# EasyEDA Pro project wzh2814685-voltpen_v0-5-3f4d7379.epro, board 主控板PCB_板厚1.0
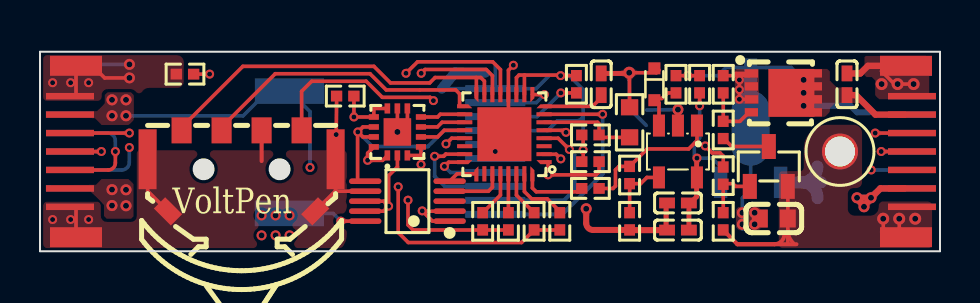
[diagram p1: board, top side]
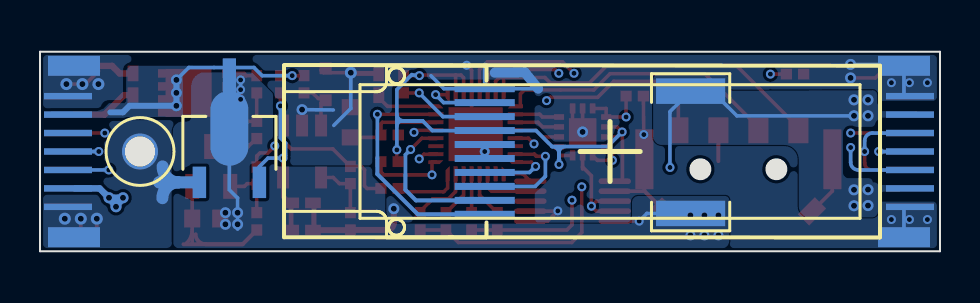
[diagram p2: board, bottom side, seen from below]

Outline 45 x 10 mm; copper layers: Top Layer, Inner1, Inner2, Bottom Layer. Coordinates in mm from the lower left corner of the outline.
Outline path: 0,10 45,10 45,0 0,0 0,10
Stack: Top Layer 0.035mm / Dielectric1 0.48mm PP er 4.5 / Inner1 0.035mm / Dielectric2 0.48mm FR4 er 4.5 / Inner2 0.035mm / Dielectric3 0.48mm PP er 4.5 / Bottom Layer 0.035mm

## Design rules (mm)
spacing safeClearance (default): track to track 0.152, other pairs 0.152 to 0.3
spacing Plane_innerPlane: track to track 0.152, other pairs 0.152 to 0.3
spacing Copper_copperRegion: track to track 0.152, other pairs 0.152 to 0.3
spacing Copper_gge50735: track to track 0.152, other pairs 0.152 to 0.3
spacing Copper_gge48593: track to track 0.152, other pairs 0.152 to 0.3
spacing Copper_gge170237: track to track 0.152, other pairs 0.152 to 0.3
spacing Copper_gge170600: track to track 0.152, other pairs 0.152 to 0.3
spacing Copper_gge170609: track to track 0.152, other pairs 0.152 to 0.3
spacing Copper_gge170501: track to track 0.152, other pairs 0.152 to 0.3
spacing Copper_gge170618: track to track 0.152, other pairs 0.152 to 0.3
spacing Copper_gge58469: track to track 0.152, other pairs 0.152 to 0.3
spacing Copper_gge67118: track to track 0.152, other pairs 0.152 to 0.3
track width trackWidth (default): min 0.127, default 0.254, max 2.54
differential pair differentialPair (default): width min 0.127, default 0.254, max 2.54; gap min 0.152, default 0.152
pour e532 uses Copper_copperRegion, gge50735
pour e539 uses Copper_copperRegion, gge170237
pour e541 uses Copper_copperRegion, gge170600
pour e543 uses Copper_copperRegion, gge170609
pour e545 uses Copper_copperRegion, gge170501
pour e547 uses Copper_copperRegion, gge170618
pour e550 uses Copper_copperRegion, gge58469
pour e552 uses Copper_copperRegion, gge67118
pour e537 uses Copper_copperRegion

## Placement (name value [footprint] x y rotation side)
C1  10uF  [C0603]  36.69 1.64 0 top
C2  10uF  [C0402]  31.9 1.06 180 top
C3  100nF  [C0402]  28.06 8.37 270 top
C4  100nF  [C0402]  31.9 2.42 0 top
C5  100nF  [C0402]  40.35 8.37 270 top
D1  1N4148WT  [SOD-523_L1.2-W0.8-LS1.6-FD]  30.72 8.37 270 top
NOREF  -  [Pad_e86]  40 5 0 top
Q1  WSD30L30DN  [WDFN-8_L3.3-W3.3-P0.65-BL]  37.17 7.94 270 top
Q2  S8050 J3Y  [SOT-23-3_L2.9-W1.3-P1.90-LS2.4-BR]  36.44 4.25 270 top
R1  10kΩ  [R0402]  27.52 5.83 180 top
R2  15R  [R0402]  26.82 8.37 90 top
R3  5.1kΩ  [R0402]  31.8 8.37 270 top
R4  1kΩ  [R0402]  29.48 1.5 90 top
R5  200kΩ  [R0402]  29.48 3.82 90 top
R6  1kΩ  [R0402]  27.52 3.15 180 top
R7  1kΩ  [R0402]  34.16 3.79 270 top
R8  1kΩ  [R0402]  34.16 6.08 90 top
R9  10kΩ  [R0402]  34.16 8.37 270 top
R10  1MΩ  [R0402]  32.98 8.37 90 top
R11  5.1kΩ  [R0402]  25.99 1.5 90 top
R12  1kΩ  [R0402]  24.7 1.5 270 top
R13  5.1kΩ  [R0402]  22.13 1.5 90 top
R14  1kΩ  [R0402]  23.42 1.5 270 top
R15  5.1kΩ  [R0402]  27.52 4.49 180 top
R16  10kΩ  [R0402]  34.16 1.5 90 top
R17  NC  [R0402]  15.26 7.78 180 top
R18  NC  [R0402]  7.25 8.88 180 top
R19  5mΩ  [R2512]  12.47 4.96 270 bottom
RT1  KNTC0603/10KF3950  [R0603]  29.48 6.46 90 top
SW1  TM-2023  [SW-SMD_TM-2023-1]  10.08 4.03 180 top
TFT-1  LCD-0.99-GC9D01  [0.99寸-GC9D01N]  16.5 5 180 bottom
U1  AI8H8K64U-45I-QFN32  [QFN-32_L4.0-W4.0-P0.40-TL-EP2.7-1]  23.22 5.87 180 top
U2  TP1541A-TR  [SOT-23-5_L3.0-W1.7-P0.95-LS2.8-BR]  31.9 5 90 top
U3  FUSB302BMPX  [MLP-14_L2.5-W2.5-P0.50-BL-EP]  17.87 5.98 0 top
U4  INA226AIDGSR  [MSOP-10_L3.0-W3.0-P0.50-LS5.0-BL]  18.37 2.51 90 top
U5  SE8533-HF  [SOT-89-3_L4.5-W2.5-P1.50-LS4.2-BR]  35.53 4.81 270 bottom
USB1  TYPE-C 14P母座 夹板  [TYPE-C 14P母座]  -3.9 5 90 top
USB2  TYPE-C 14P母座 夹板  [TYPE-C 14P母座]  49 5 270 top

## Footprints (pads in the part's own frame, mm; a bottom-side part is the same pattern mirrored in y, then rotated)
0.99寸-GC9D01N
  custom 3x0.35 smd: 1(-6.264,-3.15) 2(-6.264,-2.45) 3(-6.264,-1.75) 4(-6.264,-1.05) 5(-6.264,-0.35) 6(-6.264,0.35) 7(-6.264,1.05) 8(-6.264,1.75) 9(-6.264,2.45) 10(-6.264,3.15)
C0402
  rect 0.79x0.54 smd: 1(-0.545,0) 2(0.545,0)
C0603
  rect 0.8x0.9 smd: 1(-0.7,0) 2(0.7,0)
MLP-14_L2.5-W2.5-P0.50-BL-EP
  rect 0.28x0.505 smd: 1(-0.5,-1.177) 2(0,-1.177) 3(0.5,-1.177) 8(0.5,1.177) 9(0,1.177) 10(-0.5,1.177)
  rect 0.505x0.28 smd: 4(1.177,-0.75) 5(1.177,-0.25) 6(1.177,0.25) 7(1.177,0.75) 11(-1.177,0.75) 12(-1.177,0.25) 13(-1.177,-0.25) 14(-1.177,-0.75)
  rect 1.375x1.375 smd: 15(0,0)
MSOP-10_L3.0-W3.0-P0.50-LS5.0-BL
  oval 0.28x1.62 smd: 1(-1,-2.111) 2(-0.5,-2.111) 3(0,-2.111) 4(0.5,-2.111) 5(1,-2.111) 6(1,2.11) 7(0.5,2.11) 8(0,2.11) 9(-0.5,2.11) 10(-1,2.11)
Pad_e86
  round 1.8 hole 1.5: 4(0,0)
QFN-32_L4.0-W4.0-P0.40-TL-EP2.7-1
  custom 0.76x0.2 smd: 1(-1.985,1.4) 8(-1.985,-1.4) 17(1.985,-1.4) 24(1.985,1.4)
  rect 0.76x0.2 smd: 2(-1.985,1) 3(-1.985,0.6) 4(-1.985,0.2) 5(-1.985,-0.2) 6(-1.985,-0.6) 7(-1.985,-1) 18(1.985,-1) 19(1.985,-0.6) 20(1.985,-0.2) 21(1.985,0.2) 22(1.985,0.6) 23(1.985,1)
  custom 0.2x0.76 smd: 9(-1.401,-1.985) 16(1.399,-1.985) 25(1.399,1.985) 32(-1.401,1.985)
  rect 0.2x0.76 smd: 10(-1,-1.985) 11(-0.6,-1.985) 12(-0.2,-1.985) 13(0.2,-1.985) 14(0.6,-1.985) 15(1,-1.985) 26(1,1.985) 27(0.6,1.985) 28(0.2,1.985) 29(-0.2,1.985) 30(-0.6,1.985) 31(-1,1.985)
  rect 2.7x2.7 smd: 33(0,0)
R0402
  rect 0.566x0.54 smd: 1(-0.433,0) 2(0.433,0)
R0603
  rect 0.806x0.864 smd: 1(-0.753,0) 2(0.753,0)
R2512
  rect 1.282x3.456 smd: 1(-3.067,0) 2(3.066,0)
SOD-523_L1.2-W0.8-LS1.6-FD
  rect 0.6x0.6 smd: 1(-0.8,0) 2(0.8,0)
SOT-23-3_L2.9-W1.3-P1.90-LS2.4-BR
  rect 1.25x0.7 smd: 1(1,-0.95) 2(1,0.95) 3(-1,0)
SOT-23-5_L3.0-W1.7-P0.95-LS2.8-BR
  rect 1.1x0.6 smd: 1(1.3,-0.95) 2(1.3,0) 3(1.3,0.95) 4(-1.3,0.95) 5(-1.3,-0.95)
SOT-89-3_L4.5-W2.5-P1.50-LS4.2-BR
  rect 1.575x0.672 smd: 1(1.357,-1.5) 3(1.357,1.5)
  custom 5.377x1.9 smd: 2(-1.356,-0.001)
SW-SMD_TM-2023-1
  rect 1x1.3 smd: 1(-3,-2.03) 2(3,-2.03) C(-1,-2.03) T(1,-2.03)
  rect 0.9x3 smd: 3(-4.7,-0.58) 4(4.7,-0.58)
  rect 1.2x0.8 smd rot 135: 5(3.68,2.03)
  rect 1.2x0.8 smd rot 45: 6(-3.68,2.03)
TYPE-C 14P母座
  rect 0.32x2.4 smd: A1(2.775,-5.4) A4(1.85,-5.4) A5(0.925,-5.4) A6(0,-5.4) A7(-0.925,-5.4) A9(-1.85,-5.4) A12(-2.775,-5.4)
  rect 0.32x2.4 smd far side: B1(-2.775,-5.4) B4(-1.85,-5.4) B5(-0.925,-5.4) B6(0,-5.4) B7(0.925,-5.4) B9(1.85,-5.4) B12(2.775,-5.4)
  rect 1x2.6 smd: SH(-4.295,-5.7) SH(4.295,-5.7)
  rect 1x2.6 smd far side: SH(-4.295,-5.7) SH(4.295,-5.7)
WDFN-8_L3.3-W3.3-P0.65-BL
  rect 0.42x0.66 smd: 1(-0.975,-1.6) 2(-0.325,-1.6) 3(0.325,-1.6) 4(0.975,-1.6) 5(-0.975,1.6) 5(-0.325,1.6) 5(0.325,1.6) 5(0.975,1.6)
  rect 2.4x2.3 smd: 5(0,0.4)

## Nets
As in the schematic, except:
GND: C1.2 C2.2 C3.1 C4.1 C5.1 D1.1 NOREF.4 Q2.2 R4.1 R16.1 R17.2 R18.2 RT1.2 SW1.3 SW1.4 SW1.5 SW1.6 SW1.C TFT-1.5 TFT-1.6 TFT-1.10 U1.12 U1.33 U2.2 U3.8 U3.9 U3.15 U4.1 U4.2 U4.7 U5.1 USB1.A1 USB1.A12 USB1.B1 USB1.B12 USB1.SH USB2.A1 USB2.A12 USB2.B1 USB2.B12 USB2.SH

Pads without a net: U1 3 22 26; U4 3; USB2 A5 B5

## Via types
v1: diameter 0.45, hole 0.25, Top Layer to Bottom Layer, 48 vias
v2: diameter 0.55, hole 0.3, Top Layer to Bottom Layer, 12 vias
v3: diameter 0.6, hole 0.3, Top Layer to Bottom Layer, 7 vias
v4: diameter 0.5, hole 0.25, Top Layer to Bottom Layer, 1 via
v5: diameter 0.555, hole 0.3, Top Layer to Bottom Layer, 11 vias
v6: diameter 0.5, hole 0.3, Top Layer to Bottom Layer, 6 vias

## Routing (per net, layer and track width the routed paths; a pad name or vN(x,y) marks a point on that pad's centre or on a via; arc(x,y) is an arc through that point)
3.3V: length 50.3
  Top Layer w0.18: 24.22,8.83 23.95,8.83 23.82,8.7 23.82,7.85 ; 24.22,8.83 24.22,7.85 ; 24.22,8.83 26.03,8.83 ; 19.05,4.8 19.05,4.8 ; 19.05,4.8 18.37,4.8 ; 19.05,4.8 19.05,4.35 ; 27.16,5.71 27.16,4.43 ; 16.69,5.73 16.14,5.73 15.9,5.98 16.15,6.23 16.69,6.23 ; 19.05,4.8 19.05,5.23 ; 15.88,6.05 15.88,3.51 16.26,3.51 ; 32.98,7.94 32.98,7.28 ; 26.03,8.8 26.82,8.8
  Top Layer w0.24: 32.45,1.06 32.45,2.42 32.52,2.42 32.83,2.73 32.83,4.67
  Inner1 w0.25: v1(32.85,4.67) 27.57,4.67 v1(27.16,5.08)
  Bottom Layer w0.18: 18.74,5.25 arc(18.96,5.16) 19.05,4.94 v1(19.05,4.35) ; 19.4,5.25 arc(19.15,5.15) 19.05,4.9 v1(19.05,4.35) ; 19.4,5.25 16.62,5.25 15.89,5.98 ; 19.4,5.25 20.2,6.05 ; 27.16,6.27 arc(27.08,6.46) 26.88,6.54 25.87,6.54 26.83,6.54 arc(27.06,6.64) 27.16,6.87 ; v1(19.05,4.35) 19.05,5.25 ; v1(32.85,4.67) 32.72,4.8 32.72,5.42 32.98,5.68 v1(32.98,7.29) ; 27.16,6.54 25.87,6.54 25.38,6.05 20.2,6.05 ; 34.03,3.45 34.03,4.24 33.6,4.67 32.85,4.67 ; v1(27.16,5.08) 27.16,8.1 26.41,8.85 26.38,8.83 26.03,8.83
  vias: v1(15.89,5.98) v1(26.03,8.8)
GND: length 90.2
  Top Layer w0.18: 37.67,0.41 arc(37.46,0.72) 37.39,1.08 ; 23.22,5.86 23.42,6.06 23.42,9.08 23.67,9.32 ; 37.39,0.41 37.39,3.25 ; 14.83,7.78 14.81,5.85 ; 20.48,2.01 19.13,2.01 ; 19.13,2.01 19.11,2.02 ; 19.13,2.01 19.63,1.51 20.48,1.51 ; 4.48,8.69 3.23,8.69 2.56,9.36 1.8,9.36 1.8,7.82 1.4,7.82 ; 17.87,6.29 18.37,6.29 18.37,7.16 ; 17.87,6.29 17.87,5.98 ; 17.87,6.29 17.44,6.29 ; 17.87,6.29 17.87,7.16 ; 31.31,1.19 31.3,1.18 ; 43.68,8.38 42.72,8.38 42.07,9.03 ; 42.16,1.63 42.16,1.04 42.08,0.96 ; 30.96,9.08 30.82,8.95 29.46,8.95 ; 1.4,2.27 1.8,2.27 1.8,0.72 ; 16.26,3.01 14.78,3.01 ; 42.88,0.96 42.96,1.04 42.96,1.63 ; 29.48,7.22 29.47,8.91 ; 31.12,1.01 31.12,0.97 ; 5.38,4.61 5.38,3.02 6.4,2
  Top Layer w0.2: 37.22,0.85 arc(37.07,0.5) 36.72,0.35 34.87,0.35 ; 11.08,6.06 11.08,4.52 ; 14.78,4.61 14.78,3.02 13.76,2 ; 34.15,1.07 34.87,0.35 37.82,0.35
  Top Layer w0.25: 29.46,8.95 29.43,8.91 28.06,8.91 ; 31.9,6.3 31.9,7.1 ; 31.31,2.47 31.31,1.19 31.3,1.18 31.18,1.06 31.12,1.01 31.12,0.98
  Top Layer w0.3: 27.65,1.07 arc(27.41,1.17) 27.31,1.41 v2(27.31,2.13) ; 29.49,1.06 arc(29.48,1.06) R4.1 ; 29.48,1.07 27.66,1.07 ; 31.35,1.06 29.49,1.06
  Top Layer w0.32: 42.94,9.29 41.4,9.29 41.02,8.91 40.35,8.91
  Inner1 w0.18: 1.8,9.37 1.8,0.73
  Bottom Layer w0.18: 4.49,9.36 1.8,9.36 1.8,7.82 1.4,7.82 ; 1.4,2.27 1.8,2.27 1.8,0.72 ; v3(29.46,8.95) 29.46,7.16 30.31,6.31 ; v2(31.9,7.1) 30.33,7.08 ; 22.77,5.35 22.77,4.65 ; 22.76,8.15 19.98,8.15 ; 22.77,9.37 22.77,8.15 24.8,8.15 25.45,8.8
  Bottom Layer w0.5: 22.26,8.95 20.76,8.97 20.09,8.15
  Bottom Layer w0.6: 38.09,3.45 arc(38.65,3.22) 38.88,2.66 ; 38.87,4.25 arc(38.64,3.69) 38.07,3.45 ; 39.04,3.46 arc(39.04,3.46) 39.03,3.45 ; 37.03,3.45 39.03,3.45
  vias: v1(0.63,8.45) v1(0.63,1.59) v1(1.53,8.45) v1(1.53,1.59) v1(2.43,8.45) v1(2.43,1.59) v1(14.81,5.85) v1(19.11,2.02) v1(23.67,9.32) v3(42.08,8.38) v3(42.16,1.63) v3(42.88,8.38) v3(42.96,1.63) v3(43.68,8.38) v3(43.76,1.63) v2(4.47,9.37) v2(4.47,8.69) v2(17.87,5.98) v4(22.76,5)
VBUS: length 13.6
  Top Layer w0.18: 34.97,8.59 34.97,8.1 ; 34.69,8.8 35.46,8.8 35.57,8.91 34.8,8.91 34.69,8.8 ; 34.69,8.8 34.16,8.8 ; 15.04,1.51 16.26,1.51 ; 35.57,7.61 34.97,7.61 ; v1(34.97,8.1) v1(34.97,7.61)
  Bottom Layer w0.18: 34.97,8.59 34.97,8.1 ; 15.04,1.51 14.66,1.89 12.47,1.89 ; 35.53,6.17 35.53,3.08 35.12,2.67 v2(35.12,1.93) 35.12,1.11
  vias: v1(15.04,1.51) v1(34.97,8.59) v2(35.12,1.35) v2(35.73,1.93) v2(35.73,1.35) v6(11.08,1.8) v6(11.08,0.8) v6(11.78,1.8) v6(11.78,0.8) v6(12.48,1.8) v6(12.48,0.8)
VBUS_I: length 23
  Top Layer w0.18: 16.26,2.01 17.18,2.01 17.43,2.26 ; 17.87,4.23 17.87,4.12 ; 17.87,4.23 17.43,3.79 17.43,2.26 ; 17.87,4.23 17.87,4.8 ; 16.26,2.51 17.18,2.51 17.43,2.26
  Inner2 w0.18: v1(17.43,2.26) 15.44,2.26 v1(13.5,4.2)
  Bottom Layer w0.18: 13.5,4.2 13.5,7 12.47,8.02 11.39,8.02 10.15,6.79 4.3,6.79
  vias: v5(3.6,7.59) v5(3.6,6.79) v5(3.6,3.09) v5(3.6,2.29) v5(4.3,7.59) v5(4.3,6.79) v5(4.3,3.08) v5(4.3,2.28)
ADC_IRON: length 3.3
  Top Layer w0.18: U1.32 24.62,3.17 24.81,2.98 26.92,2.98 27.09,3.15
ADCN: length 4.8
  Top Layer w0.18: 25.21,6.46 27.88,6.46 27.96,6.39 27.96,5.83 ; 28.02,5.71 29.48,5.71
BK: length 3.2
  Top Layer w0.18: U1.9 v1(25.22,7.85)
  Bottom Layer w0.18: v1(25.22,7.85) 24.82,7.45 TFT-1.9
CC1: length 17.7
  Top Layer w0.18: 15.7,7.78 15.7,6.73 ; 15.7,6.73 16.69,6.73 16.69,7.16 17.37,7.16 ; 1.5,5.92 4.47,5.92
  Inner1 w0.18: v1(4.47,5.92) 5.18,5.92 5.98,6.73 v1(15.7,6.73)
CC2: length 31.6
  Top Layer w0.18: 17.37,4.8 17.13,4.56 16.38,4.56 16.38,4.92 16.7,5.23 ; 7.68,8.88 8.48,8.88
  Inner1 w0.18: 16.15,5.2 arc(16.31,5.13) 16.38,4.97 v1(16.38,4.56) 16.38,5.2 ; 16.38,5.03 arc(16.41,5.19) 16.5,5.32 ; 16.5,5.32 arc(16.47,5.24) 16.38,5.2 ; 16.5,5.32 16.5,6.92 arc(16.36,7.26) 16.02,7.4 8.99,7.4 arc(8.63,7.55) 8.48,7.91 v1(8.48,8.88) ; 16.38,5.2 v1(4.47,5.2)
  Bottom Layer w0.18: 4.09,4.08 arc(4.36,4.19) 4.47,4.46 v1(4.47,5.2) ; 1.5,4.07 4.09,4.07
D+: length 37.4
  Top Layer w0.18: 1.4,5 3.07,5 ; v1(18.4,2.56) 18.4,1.32 18.66,1.06 23.42,1.06 ; v1(19.06,8.92) 19.25,9.11 22.31,9.11 ; 22.62,7.85 22.62,8.8 22.31,9.11
  Inner1 w0.18: v1(19.06,8.92) 19.06,5.24 18.4,4.58 v1(18.4,2.56) 17.81,2.56 17.61,2.76 7.56,2.76 6.23,4.09 3.98,4.09 v1(3.07,5)
  Bottom Layer w0.18: 2.97,5.05 arc(2.97,5.05) 2.97,5.05 ; 3.07,5 1.4,5
D-: length 44.4
  Top Layer w0.18: 3.41,4.08 arc(3.66,4.18) 3.77,4.43 v1(3.77,5) ; 25.99,1.06 24.71,1.06 24.08,0.44 18.41,0.44 ; v1(17.91,3.23) 17.91,0.94 18.41,0.44 ; 23.02,7.85 23.02,9.11 22.63,9.5 18.88,9.5 v1(18.3,8.92) ; 1.5,4.07 3.42,4.07
  Inner1 w0.18: 3.66,5 3.77,5 4.31,4.46 6.41,4.46 7.64,3.23 v1(17.91,3.23) 17.91,4.6 18.7,5.39 18.7,8.52 v1(18.3,8.92)
  Bottom Layer w0.18: 3.38,5.92 arc(3.65,5.81) 3.77,5.53 v1(3.77,5) ; 1.5,5.92 3.38,5.92
D/C: length 5.9
  Top Layer w0.18: U1.23 20.29,4.87 ; 20.29,4.87 20.19,4.77 ; 20.29,4.87 20.18,4.76 v1(19.73,4.76)
  Bottom Layer w0.18: 22.76,3.25 20.24,3.25 19.76,3.73 ; v1(19.73,4.76) 19.73,3.76 19.76,3.73
DD+: length 2
  Top Layer w0.18: 23.42,3.88 23.42,1.93
DD-: length 2.3
  Top Layer w0.18: 24.71,1.93 23.82,2.81 23.82,3.88
H_ID: length 25.4
  Top Layer w0.18: 42.06,5 43.6,5 ; 27.96,4.49 27.96,3.98 27.8,3.83 25.4,3.83 25.4,4.47 25.21,4.47
  Inner1 w0.18: v1(42.06,5) 42.06,3.62 41.74,3.3 26.77,3.3 26.24,3.83 v1(25.4,3.83)
  Bottom Layer w0.18: 42.06,5 43.6,5
INT302: length 2.3
  Top Layer w0.18: 21.24,6.07 20.22,6.07 19.88,5.73 19.05,5.73
K1: length 14.5
  Top Layer w0.18: 21.23,7.27 20.98,7.27 20.98,7.89 20.78,8.09 17.31,8.09 16.5,8.9 11.76,8.9 9.08,6.22 9.08,6.06
K2: length 18.6
  Top Layer w0.18: 21.82,8.71 19.76,8.71 19.48,8.44 17.53,8.44 16.7,9.27 10.14,9.27 7.08,6.21 7.08,6.06 ; 21.82,8.71 22.04,8.71 22.22,8.53 U1.15 ; 21.82,8.71 21.82,7.85
K3: length 12.6
  Top Layer w0.18: 19.67,7.55 19.5,7.72 17.11,7.72 16.31,8.52 13.58,8.52 13.08,8.02 13.08,6.06 ; 21.24,5.67 20.58,5.67 v1(20.3,5.38)
  Inner1 w0.18: v1(19.67,7.55) 19.67,6.01 v1(20.3,5.38)
PWM: length 10
  Top Layer w0.18: 25.21,6.07 26.19,6.07 26.3,5.96 ; 33.26,5.28 33.61,4.93 34,4.93 34.16,4.77 34.16,4.22
  Inner1 w0.18: v1(33.26,5.28) 27.85,5.28 27.17,5.96 v1(26.3,5.96)
RES: length 3.7
  Top Layer w0.18: 20.22,4.25 20.43,4.46 21.15,4.46
  Bottom Layer w0.18: 22.77,3.95 20.53,3.95 20.22,4.25
  vias: v1(20.22,4.25)
SCL: length 7.9
  Top Layer w0.18: 25.12,5.66 25.91,5.66 26.47,5.1
  Bottom Layer w0.18: 26.73,3.82 26.73,4.84 ; v1(26.47,5.1) 26.73,4.84
  Bottom Layer w0.2: 26.73,3.82 26.73,3.08 26.2,2.55 TFT-1.2
SCL226: length 1.5
  Top Layer w0.18: 20.48,3.51 20.85,3.88 U1.25
SCL302: length 2.3
  Top Layer w0.18: 19.05,6.23 19.87,6.23 20.1,6.46 21.24,6.46
SDA: length 12.2
  Top Layer w0.18: 25.12,6.87 28.13,6.87
  Bottom Layer w0.18: v1(28.13,6.87) 28.13,4.65
  Bottom Layer w0.2: 28.13,4.65 28.13,3.87 26.11,1.85 22.76,1.85
SDA226: length 2.9
  Top Layer w0.18: U1.27 22.62,3.21 22.42,3.01 20.48,3.01
SDA302: length 2.2
  Top Layer w0.18: 19.05,6.73 19.88,6.73 20.01,6.87 21.24,6.87
SLP: length 22.9
  Top Layer w0.18: 25.12,4.86 25.81,4.86 26.04,4.63 ; 41.76,5.92 43.6,5.92
  Inner1 w0.18: v1(41.76,5.92) 41.56,5.72 v1(41.56,4.08) 41.16,3.68 26.99,3.68 v1(26.04,4.63)
  Bottom Layer w0.18: 41.56,4.08 43.6,4.08
TEMP: length 31.7
  Top Layer w0.18: 31.8,8.8 32.98,8.8
  Top Layer w0.3: v5(41.55,2.68) v5(40.85,2.68)
  Top Layer w0.32: 43.24,6.85 41.77,6.85 40.8,7.83 40.35,7.83 ; v5(40.85,2.68) v5(41.2,2.23) v5(41.55,2.68) ; 43.24,3.15 42.02,3.15 41.55,2.68
  Inner1 w0.6: v5(41.55,2.68) v5(41.2,2.23) v5(40.85,2.68) 42.17,2.68 arc(42.58,2.85) 42.75,3.26 42.75,6.53 arc(42.58,6.93) 42.18,7.1 40.85,7.1
  Bottom Layer w0.18: v1(32.39,8.8) 33.89,8.8 34.3,9.21 37.56,9.21 v2(38.18,8.59)
  Bottom Layer w0.3: 41.48,6.97 40.85,6.97 40.53,7.29 v2(38.18,7.29) v2(38.18,7.94) v2(38.18,8.59)
  Bottom Layer w0.32: 41.55,2.68 42.02,3.15 43.24,3.15 ; v5(41.2,2.23) v5(40.85,2.68) v5(41.55,2.68) v5(41.2,2.23)
UD+: length 2.3
  Top Layer w0.18: 23.02,3.88 23.02,2.82 22.14,1.93
UD-: length 3.1
  Top Layer w0.18: 24.22,3.88 24.22,2.99 24.58,2.63 25.36,2.63 25.99,2 25.99,1.93
$1N32: length 4.5
  Top Layer w0.18: 26.04,7.94 26.82,7.94
  Bottom Layer w0.18: 22.76,6.75 24.85,6.75 26.04,7.94
  vias: v1(26.04,7.94)
$1N39: length 3.2
  Top Layer w0.18: 25.21,7.26 27.63,7.26 28.06,7.7 28.06,7.83
$1N64: length 7.1
  Top Layer w0.18: 28.02,3.15 28.65,3.15 28.77,3.27 28.77,4.08 28.95,4.25 29.48,4.25 30.36,5.13 32.43,5.13 32.85,5.55 32.85,6.3
$1N65: length 2.9
  Top Layer w0.18: 29.62,3.39 30.03,3.39 30.34,3.7 30.95,3.7 ; 29.48,3.39 29.48,1.93
$1N66: length 2.7
  Top Layer w0.18: 30.95,6.3 30.95,7.42 30.72,7.66 31.09,7.66 31.37,7.94 R3.2
$1N74: length 2.8
  Top Layer w0.18: 35.49,3.25 34.78,3.25 34.65,3.39 34.16,3.39 34.16,1.93
$1N893: length 2.4
  Top Layer w0.18: 34.16,5.65 34.19,5.65 34.59,5.25 36.44,5.25
$1N902: length 3
  Top Layer w0.18: 34.16,7.94 34.16,6.51 34.99,6.51 35.45,6.96 35.57,6.96

## Copper pours and planes (outline as drawn; the poured copper is in the pictures)
GND on Top Layer: 39.96,0.2 44.38,0.2 44.46,0.24 44.5,0.32 44.5,2.34 44.49,2.38 44.45,2.39 42.04,2.39 42.04,2.22 41.88,1.84 41.5,1.68 40.74,1.68 40.42,1.81 40.29,2.13 40.29,2.88 40.4,3.16 40.68,3.27 40.82,3.27 40.95,3.32 41,3.45 41,5.93 40.91,6.15 40.69,6.24 39.38,6.24 38.61,5.92 38.29,5.15 38.29,4.19 38.21,3.99 38.01,3.91 37.08,3.91 37.05,3.9 37.04,3.87 37.04,0.27 37.02,0.23 36.98,0.21
GND on Top Layer: 41.22,9.79 44.46,9.79 44.46,7.62 41.22,7.62
GND on Bottom Layer: -1.03,-0.3 -0.51,-1.56 0.75,-2.08 45.35,-2.08 46.35,-1.67 46.76,-0.67 46.76,10.62 46.7,10.75 46.57,10.81 -0.02,10.81 -0.71,10.52 -1,9.83
VBUS on Top Layer: 34.8,2.22 36.03,2.22 36.03,1.05 34.8,1.05
VBUS on Top Layer: 34.74,9.14 35.95,9.14 35.95,7.4 34.74,7.4
VBUS on Bottom Layer: 10.64,0.53 10.72,0.32 10.93,0.24 38.01,0.24 38.19,0.31 38.26,0.49 38.26,6.01 38.15,6.29 37.87,6.4 37.66,6.4 37.43,6.49 37.34,6.72 37.34,8.25 37.15,8.7 36.7,8.89 34.48,8.89 33.45,7.86 33.45,4.61 33.31,4.28 32.98,4.14 28.52,4.14 28.04,3.94 27.84,3.46 27.84,2.01 27.63,1.49 27.11,1.28 15.45,1.28 15.34,1.32 15.3,1.43 15.3,2.45 15.24,2.61 15.08,2.67 10.74,2.67 10.67,2.64 10.64,2.57
VBUS_I on Top Layer: 0.29,7.97 4.69,7.97 4.69,6.33 0.29,6.33
VBUS_I on Top Layer: 0.29,3.62 4.68,3.62 4.68,1.63 0.29,1.63
VBUS_I on Bottom Layer: 1.09,7.25 6.64,7.25 6.64,2.49 1.09,2.49
VBUS_I on Inner1: 3.2,8.01 4.72,8.01 4.72,6.42 3.2,6.42
TEMP on Top Layer: 37.57,9.14 41.08,9.14 41.08,6.74 37.57,6.74
TEMP on Bottom Layer: 37.85,9.15 44.46,9.15 44.46,6.69 37.85,6.69
TEMP on Bottom Layer: 37.36,9.3 40.69,9.3 40.69,7.99 37.36,7.99
TEMP on Inner1: 37.63,9.05 41.48,9.05 41.48,6.8 37.63,6.8
GND on Top Layer: -0.18,-0.12 14.25,-0.12 14.95,0.17 15.24,0.87 15.24,4.94 15.25,4.95 15.26,4.96 5.18,4.96 5.01,5.03 4.94,5.2 4.94,7.78 5.09,8.14 5.45,8.29 6.9,8.29 7.01,8.35 7.08,8.44 7.09,9.49 7,9.67 6.81,9.73 0.06,9.73 -0.17,9.63 -0.27,9.4
GND on Inner1: 0.11,10.41 -0.04,10.35 -0.1,10.2 -0.1,-0.3 0.09,-0.76 0.55,-0.95 44.95,-0.95 45.58,-0.69 45.84,-0.06 45.84,9.82 45.59,10.41 45,10.66
GND on Inner2: -0.42,10.6 -0.42,0.07 -0.23,-0.4 0.24,-0.59 45.44,-0.59 45.74,-0.47 45.86,-0.17 45.86,10.56 45.82,10.66 45.72,10.7
VBUS on Inner1: 37.48,0.23 38.01,0.23 38.19,0.3 38.26,0.48 38.26,3.05 38.18,3.25 37.98,3.33 30.79,3.33 30.51,3.22 30.4,2.94 30.4,2.16 30.14,1.53 29.51,1.27 14.46,1.27 14.33,1.33 14.27,1.46 14.27,2.52 14.23,2.6 14.15,2.64 10.75,2.64 10.67,2.61 10.64,2.53 10.64,0.49 10.71,0.33 10.87,0.26 10.9,0.26 10.91,0.25 10.92,0.24 10.99,0.24
VBUS on Inner2: 37.88,3.33 37.97,3.33 38.18,3.24 38.27,3.03 38.27,0.43 38.22,0.3 38.09,0.25 10.77,0.25 10.7,0.28 10.67,0.35 10.67,2.55 10.7,2.62 10.77,2.65 14.18,2.65 14.25,2.62 14.28,2.55 14.28,1.54 14.36,1.36 14.54,1.28 20.19,1.28 20.44,1.38 20.54,1.63 20.54,1.73 20.62,1.91 20.8,1.99 29.99,1.99 30.42,2.17 30.6,2.6 30.6,3 30.69,3.22 30.91,3.31
VBUS_I on Bottom Layer: 3.4,1.8 3.26,1.86 3.2,2 3.2,2.29 3,2.78 2.51,2.98 0.3,2.98 0.29,2.99 0.29,3.31 0.3,3.34 0.33,3.35 3.34,3.35 3.43,3.39 3.49,3.54 3.55,3.56 4.59,3.56 4.84,3.67 4.95,3.92 4.95,5.93 4.83,6.22 4.54,6.34 3.38,6.34 3.35,6.35 3.25,6.59 3.04,6.68 0.3,6.68 0.29,6.69 0.29,7.03 2.78,7.03 3.11,7.16 3.24,7.49 3.24,7.84 3.28,7.93 3.37,7.97 10.42,7.94 10.56,8.03 10.67,8.16 10.67,8.64 10.7,8.7 10.76,8.73 14.16,8.73 14.22,8.71 14.24,8.65 14.24,5.76 14.14,5.53 13.91,5.43 7.79,5.43 7.2,5.19 6.96,4.6 6.96,2.25 6.83,1.93 6.51,1.8

Small or netless copper shapes (teardrops, artwork), in the pictures only: 56 on Top Layer, 44 on Bottom Layer, 26 on Inner1, 2 on Inner2

## Text on the board
Top Silkscreen Layer: VoltPen
